# Altium schematic sheet 1.Block Diagram.SchDoc
size A3; DocumentNumber: 1; SheetNumber: 1
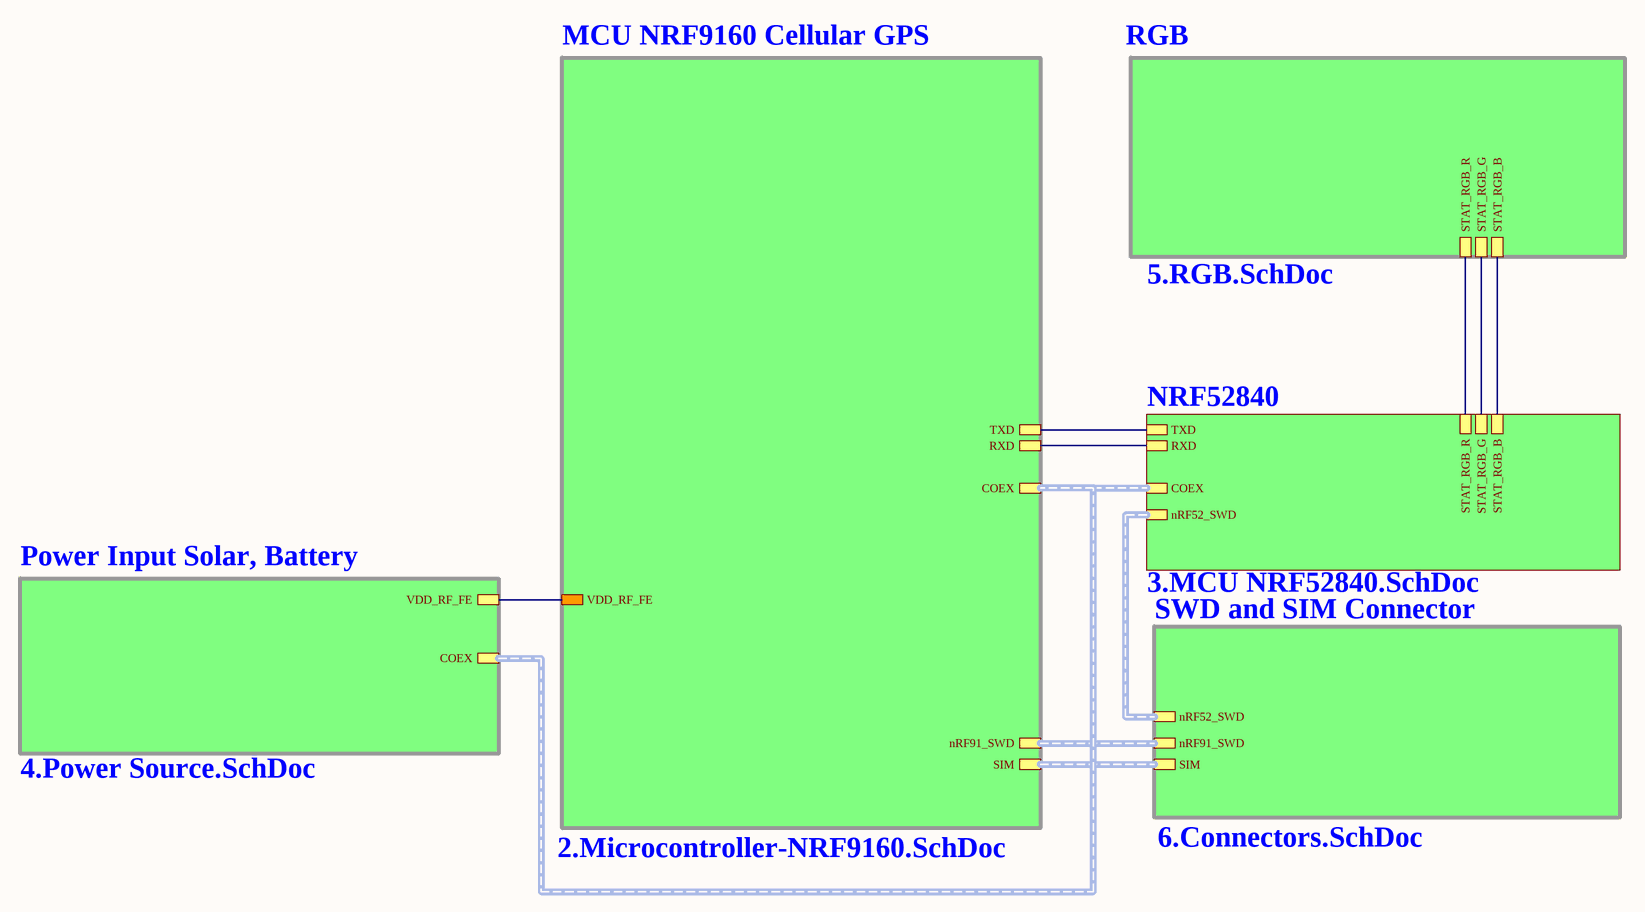
[diagram p0: 1.Block Diagram.SchDoc]

## Sub-sheets
MCU NRF9160 Cellular GPS = 2.Microcontroller-NRF9160.SchDoc: nRF91_SWD (harness SWD), SIM (harness SIM), VDD_RF_FE, COEX (harness COEX), TXD, RXD
NRF52840 = 3.MCU NRF52840.SchDoc: COEX (harness COEX), nRF52_SWD (harness SWD), STAT_RGB_R, STAT_RGB_G, STAT_RGB_B, TXD, RXD
Power Input Solar, Battery = 4.Power Source.SchDoc: COEX (harness COEX), VDD_RF_FE
RGB = 5.RGB.SchDoc: STAT_RGB_R, STAT_RGB_B, STAT_RGB_G
SWD and SIM Connector = 6.Connectors.SchDoc: SIM (harness SIM), nRF91_SWD (harness SWD), nRF52_SWD (harness SWD)

## Nets
(unnamed): sheet MCU NRF9160 Cellular GPS/VDD_RF_FE, sheet Power Input Solar, Battery/VDD_RF_FE
(unnamed): sheet MCU NRF9160 Cellular GPS/TXD, sheet NRF52840/TXD
(unnamed): sheet MCU NRF9160 Cellular GPS/RXD, sheet NRF52840/RXD
(unnamed): sheet RGB/STAT_RGB_R, sheet NRF52840/STAT_RGB_R
(unnamed): sheet RGB/STAT_RGB_B, sheet NRF52840/STAT_RGB_B
(unnamed): sheet RGB/STAT_RGB_G, sheet NRF52840/STAT_RGB_G

## Buses and harness runs
harness sheet MCU NRF9160 Cellular GPS/COEX = sheet NRF52840/COEX = sheet Power Input Solar, Battery/COEX
harness sheet MCU NRF9160 Cellular GPS/nRF91_SWD = sheet SWD and SIM Connector/nRF91_SWD
harness sheet MCU NRF9160 Cellular GPS/SIM = sheet SWD and SIM Connector/SIM
harness sheet NRF52840/nRF52_SWD = sheet SWD and SIM Connector/nRF52_SWD